# Altium schematic sheet Sheet1.SchDoc
size A3; SheetNumber: 1; SheetTotal: 1
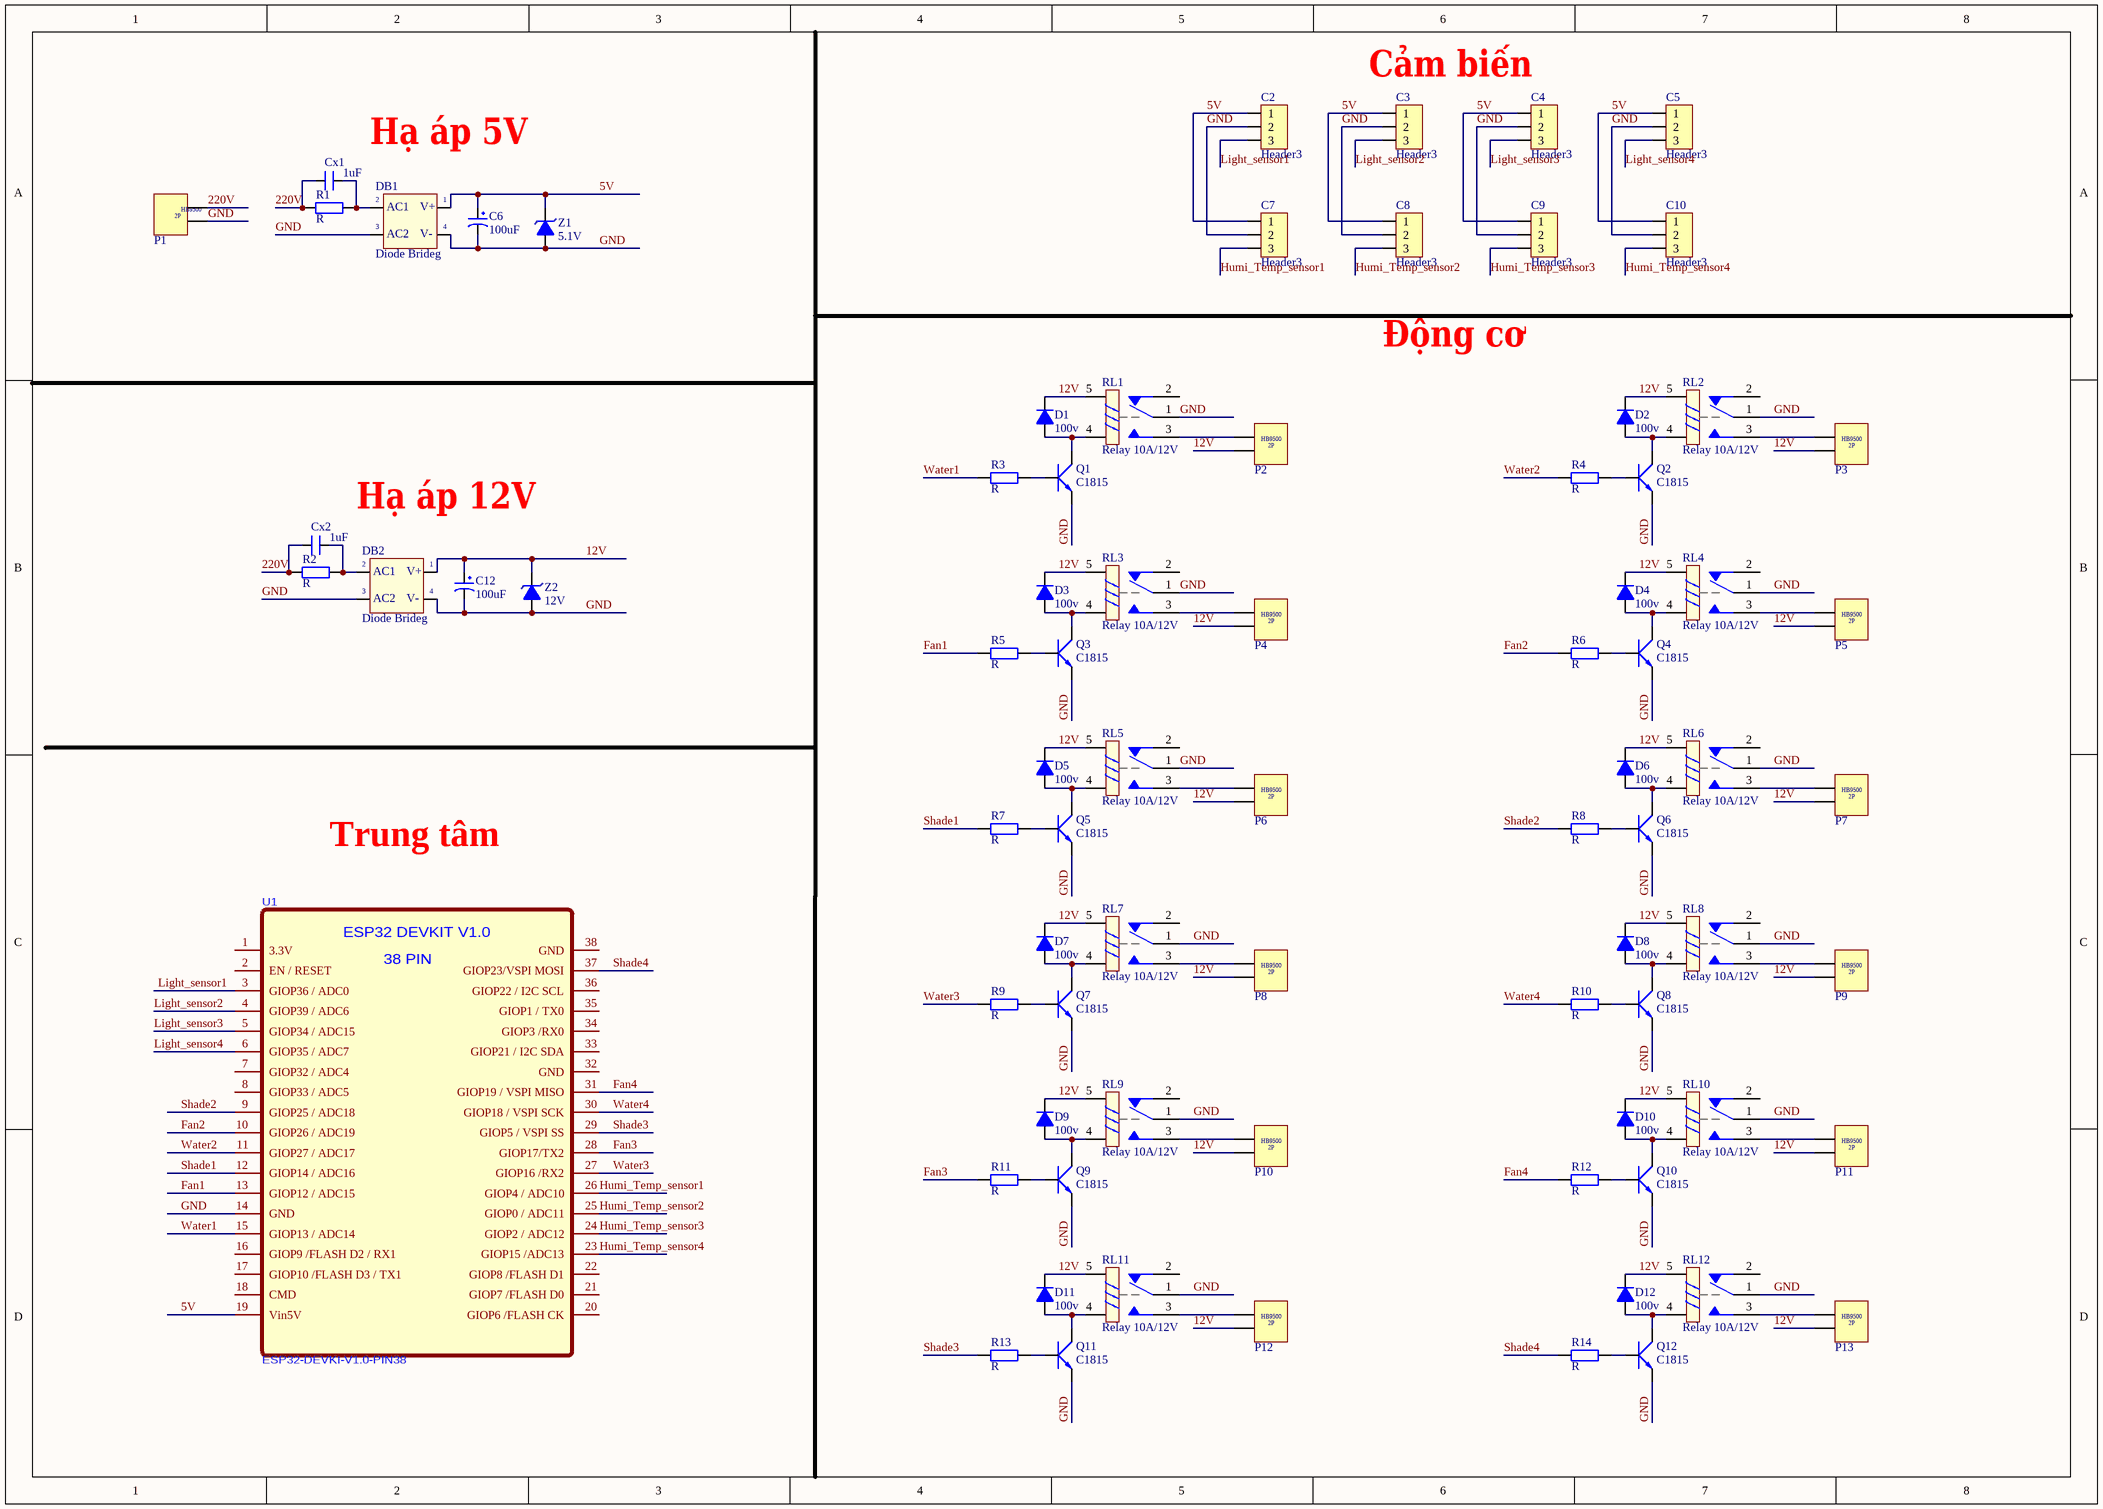
[diagram p0: Sheet1.SchDoc]

## Parts
C2  Header3  [HDR3]
C3  Header3  [HDR3]
C4  Header3  [HDR3]
C5  Header3  [HDR3]
C6  100uF  [tu hoa 5mm]
C7  Header3  [HDR3]
C8  Header3  [HDR3]
C9  Header3  [HDR3]
C10  Header3  [HDR3]
C12  100uF  [tu hoa 5mm]
Cx1  1uF  [CN1]
Cx2  1uF  [CN1]
D1  100v  [DIODE 1A]
D2  100v  [DIODE 1A]
D3  100v  [DIODE 1A]
D4  100v  [DIODE 1A]
D5  100v  [DIODE 1A]
D6  100v  [DIODE 1A]
D7  100v  [DIODE 1A]
D8  100v  [DIODE 1A]
D9  100v  [DIODE 1A]
D10  100v  [DIODE 1A]
D11  100v  [DIODE 1A]
D12  100v  [DIODE 1A]
DB1  Diode Brideg  [CAU 1A]
DB2  Diode Brideg  [CAU 1A]
P1  HB9500-2P  [HB9500-2P]  (value not drawn)
P2  HB9500-2P  [HB9500-2P]  (value not drawn)
P3  HB9500-2P  [HB9500-2P]  (value not drawn)
P4  HB9500-2P  [HB9500-2P]  (value not drawn)
P5  HB9500-2P  [HB9500-2P]  (value not drawn)
P6  HB9500-2P  [HB9500-2P]  (value not drawn)
P7  HB9500-2P  [HB9500-2P]  (value not drawn)
P8  HB9500-2P  [HB9500-2P]  (value not drawn)
P9  HB9500-2P  [HB9500-2P]  (value not drawn)
P10  HB9500-2P  [HB9500-2P]  (value not drawn)
P11  HB9500-2P  [HB9500-2P]  (value not drawn)
P12  HB9500-2P  [HB9500-2P]  (value not drawn)
P13  HB9500-2P  [HB9500-2P]  (value not drawn)
Q1  C1815  [TO92]
Q2  C1815  [TO92]
Q3  C1815  [TO92]
Q4  C1815  [TO92]
Q5  C1815  [TO92]
Q6  C1815  [TO92]
Q7  C1815  [TO92]
Q8  C1815  [TO92]
Q9  C1815  [TO92]
Q10  C1815  [TO92]
Q11  C1815  [TO92]
Q12  C1815  [TO92]
R1  value R  [DIEN TRO 1/4 W]  (hidden comment: 100K)
R2  value R  [DIEN TRO 1/4 W]  (hidden comment: 100K)
R3  value R  [DIEN TRO 1/4 W]  (hidden comment: 500)
R4  value R  [DIEN TRO 1/4 W]  (hidden comment: 500)
R5  value R  [DIEN TRO 1/4 W]  (hidden comment: 500)
R6  value R  [DIEN TRO 1/4 W]  (hidden comment: 500)
R7  value R  [DIEN TRO 1/4 W]  (hidden comment: 500)
R8  value R  [DIEN TRO 1/4 W]  (hidden comment: 500)
R9  value R  [DIEN TRO 1/4 W]  (hidden comment: 500)
R10  value R  [DIEN TRO 1/4 W]  (hidden comment: 500)
R11  value R  [DIEN TRO 1/4 W]  (hidden comment: 500)
R12  value R  [DIEN TRO 1/4 W]  (hidden comment: 500)
R13  value R  [DIEN TRO 1/4 W]  (hidden comment: 500)
R14  value R  [DIEN TRO 1/4 W]  (hidden comment: 500)
RL1  Relay 10A/12V  [RELAY 5]
RL2  Relay 10A/12V  [RELAY 5]
RL3  Relay 10A/12V  [RELAY 5]
RL4  Relay 10A/12V  [RELAY 5]
RL5  Relay 10A/12V  [RELAY 5]
RL6  Relay 10A/12V  [RELAY 5]
RL7  Relay 10A/12V  [RELAY 5]
RL8  Relay 10A/12V  [RELAY 5]
RL9  Relay 10A/12V  [RELAY 5]
RL10  Relay 10A/12V  [RELAY 5]
RL11  Relay 10A/12V  [RELAY 5]
RL12  Relay 10A/12V  [RELAY 5]
U1  ESP32-DEVKI-V1.0-PIN38  [ESP32-DEVKIT-V1.0-38PIN]
Z1  5.1V  [D1A]
Z2  12V  [D1A]

## Nets
5V: C2.1 C3.1 C4.1 C5.1 C6.1 C7.1 C8.1 C9.1 C10.1 DB1.1(+V_OUT) U1.19(Vin5V) Z1.2(K)
12V: C12.1 D1.2(K) D2.2(K) D3.2(K) D4.2(K) D5.2(K) D6.2(K) D7.2(K) D8.2(K) D9.2(K) D10.2(K) D11.2(K) D12.2(K) DB2.1(+V_OUT) P2.2 P3.2 P4.2 P5.2 P6.2 P7.2 P8.2 P9.2 P10.2 P11.2 P12.2 P13.2 RL1.5 RL2.5 RL3.5 RL4.5 RL5.5 RL6.5 RL7.5 RL8.5 RL9.5 RL10.5 RL11.5 RL12.5 Z2.2(K)
220V: Cx1.1 Cx2.1 P1.1 R1.1 R2.1
Fan1: R5.1 U1.13(GIOP12_/_ADC15)
Fan2: R6.1 U1.10(GIOP26_/_ADC19)
Fan3: R11.1 U1.28(GIOP17/TX2)
Fan4: R12.1 U1.31(GIOP19_/_VSPI_MISO)
GND: C2.2 C3.2 C4.2 C5.2 C6.2 C7.2 C8.2 C9.2 C10.2 C12.2 DB1.3(AC2) DB1.4(-V_OUT) DB2.3(AC2) DB2.4(-V_OUT) P1.2 Q1.1(E) Q2.1(E) Q3.1(E) Q4.1(E) Q5.1(E) Q6.1(E) Q7.1(E) Q8.1(E) Q9.1(E) Q10.1(E) Q11.1(E) Q12.1(E) RL1.1 RL2.1 RL3.1 RL4.1 RL5.1 RL6.1 RL7.1 RL8.1 RL9.1 RL10.1 RL11.1 RL12.1 U1.14(GND) Z1.1(A) Z2.1(A)
Humi_Temp_sensor1: C7.3 U1.26(GIOP4_/_ADC10)
Humi_Temp_sensor2: C8.3 U1.25(GIOP0_/_ADC11)
Humi_Temp_sensor3: C9.3 U1.24(GIOP2_/_ADC12)
Humi_Temp_sensor4: C10.3 U1.23(GIOP15_/ADC13)
Light_sensor1: C2.3 U1.3(GIOP36_/_ADC0)
Light_sensor2: C3.3 U1.4(GIOP39_/_ADC6)
Light_sensor3: C4.3 U1.5(GIOP34_/_ADC15)
Light_sensor4: C5.3 U1.6(GIOP35_/_ADC7)
Shade1: R7.1 U1.12(GIOP14_/_ADC16)
Shade2: R8.1 U1.9(GIOP25_/_ADC18)
Shade3: R13.1 U1.29(GIOP5_/_VSPI_SS)
Shade4: R14.1 U1.37(GIOP23/VSPI_MOSI)
Water1: R3.1 U1.15(GIOP13_/_ADC14)
Water2: R4.1 U1.11(GIOP27_/_ADC17)
Water3: R9.1 U1.27(GIOP16_/RX2)
Water4: R10.1 U1.30(GIOP18_/_VSPI_SCK)
NetCx1_2: Cx1.2 DB1.2(AC1) R1.2
NetCx2_2: Cx2.2 DB2.2(AC1) R2.2
NetD1_1: D1.1(A) Q1.2(C) RL1.4
NetD2_1: D2.1(A) Q2.2(C) RL2.4
NetD3_1: D3.1(A) Q3.2(C) RL3.4
NetD4_1: D4.1(A) Q4.2(C) RL4.4
NetD5_1: D5.1(A) Q5.2(C) RL5.4
NetD6_1: D6.1(A) Q6.2(C) RL6.4
NetD7_1: D7.1(A) Q7.2(C) RL7.4
NetD8_1: D8.1(A) Q8.2(C) RL8.4
NetD9_1: D9.1(A) Q9.2(C) RL9.4
NetD10_1: D10.1(A) Q10.2(C) RL10.4
NetD11_1: D11.1(A) Q11.2(C) RL11.4
NetD12_1: D12.1(A) Q12.2(C) RL12.4
NetP2_1: P2.1 RL1.3
NetP3_1: P3.1 RL2.3
NetP4_1: P4.1 RL3.3
NetP5_1: P5.1 RL4.3
NetP6_1: P6.1 RL5.3
NetP7_1: P7.1 RL6.3
NetP8_1: P8.1 RL7.3
NetP9_1: P9.1 RL8.3
NetP10_1: P10.1 RL9.3
NetP11_1: P11.1 RL10.3
NetP12_1: P12.1 RL11.3
NetP13_1: P13.1 RL12.3
NetQ1_3: Q1.3(B) R3.2
NetQ2_3: Q2.3(B) R4.2
NetQ3_3: Q3.3(B) R5.2
NetQ4_3: Q4.3(B) R6.2
NetQ5_3: Q5.3(B) R7.2
NetQ6_3: Q6.3(B) R8.2
NetQ7_3: Q7.3(B) R9.2
NetQ8_3: Q8.3(B) R10.2
NetQ9_3: Q9.3(B) R11.2
NetQ10_3: Q10.3(B) R12.2
NetQ11_3: Q11.3(B) R13.2
NetQ12_3: Q12.3(B) R14.2

Not connected (* = marked no-connect by the designer): RL1 2; RL2 2; RL3 2; RL4 2; RL5 2; RL6 2; RL7 2; RL8 2; RL9 2; RL10 2; RL11 2; RL12 2; U1 1(3.3V) 2(EN_/_RESET) 7(GIOP32_/_ADC4) 8(GIOP33_/_ADC5) 16(GIOP9_/FLASH_D2_/_RX1) 17(GIOP10_/FLASH_D3_/_TX1) 18(CMD) 20(GIOP6_/FLASH_CK) 21(GIOP7_/FLASH_D0) 22(GIOP8_/FLASH_D1) 32(GND) 33(GIOP21_/_I2C_SDA) 34(GIOP3_/RX0) 35(GIOP1_/_TX0) 36(GIOP22_/_I2C_SCL) 38(GND)

## Notes on the sheet
- Cảm biến
- Hạ áp 5V
- Động cơ
- Hạ áp 12V
- Trung tâm
- (in symbol DB) V+; V-
- (in symbol ESP32-DEVKI-V1.0-PIN38) ESP32 DEVKIT V1.0; 38 PIN
- (in symbol HB9500-2P) HB9500; 2P

## Library data of the parts
C2-C5 C7-C10 = Header3: Header IDC, 3 x 1 Pin Vertical 2.54mm Pitch (Non-Boxed, Male); Manufacturer: W¨¹rth Elektronik eiSos GmbH; partNo: 613002143121; ComponentLink1 Description: Manufacturer; ComponentLink2 Description: Datasheet; NoPins: 02; Created Date: 29 March 2013; ComponentLink1URL: http://www.we-online.com; ComponentLink2URL: http://katalog.we-online.de/em/datasheet/6130xx143121.pdf; Created by: Karrer Zheng
C6 C12 = Tu Hoa 100uF 16V 5x7: Cắm; Don_Vi: Con; So_Chan: 2; Ten_Linh_Kien: Tụ Hóa 100uF 16V 5x7MM; Ma_Hang: MH001347; Chung_Loai: Cắm; Kieu_Chan: *
Cx1 Cx2 = CAP-DIP: Cremic For Xtal 1pF => 100pF; Value: 33pF
D1-D12 = Diode 1N4007: Cắm; Ten_Linh_Kien: Diode 1N4007 1A (DIP); Don_Vi: Con; Ma_Hang: MH001063; Ghi Chu: *; Kieu_Chan: *; Chung_Loai: Cắm
DB1 DB2 = DB: Convert AC to DC voltage, 4 pin; Value: Cau 1A
P1-P13 = HB9500-2P: Terminal Block, Header, 2P, 15A, 300VAC Rohs Compliant: Yes
Q1-Q12 = Trans C1815 DIP: NPN transistor; Value: C9014
R1-R14 = Res 1/4 W: Resistor; Published: 8-Jun-2000; LatestRevisionDate: 17-Jul-2002; LatestRevisionNote: Re-released for DXP Platform.; PackageReference: AXIAL-0.4; Publisher: Altium Limited
RL1-RL12 = Relay 5: Relay SPDT,10A - 12VDC 5 Pin; Value: Relay SPDT, 10A, 12V
Z1 Z2 = Diode Zener: Diode  Zener